# Altium schematic sheet ESP32_S3_TypeC.SchDoc
size A2; SheetNumber: 1; SheetTotal: 1
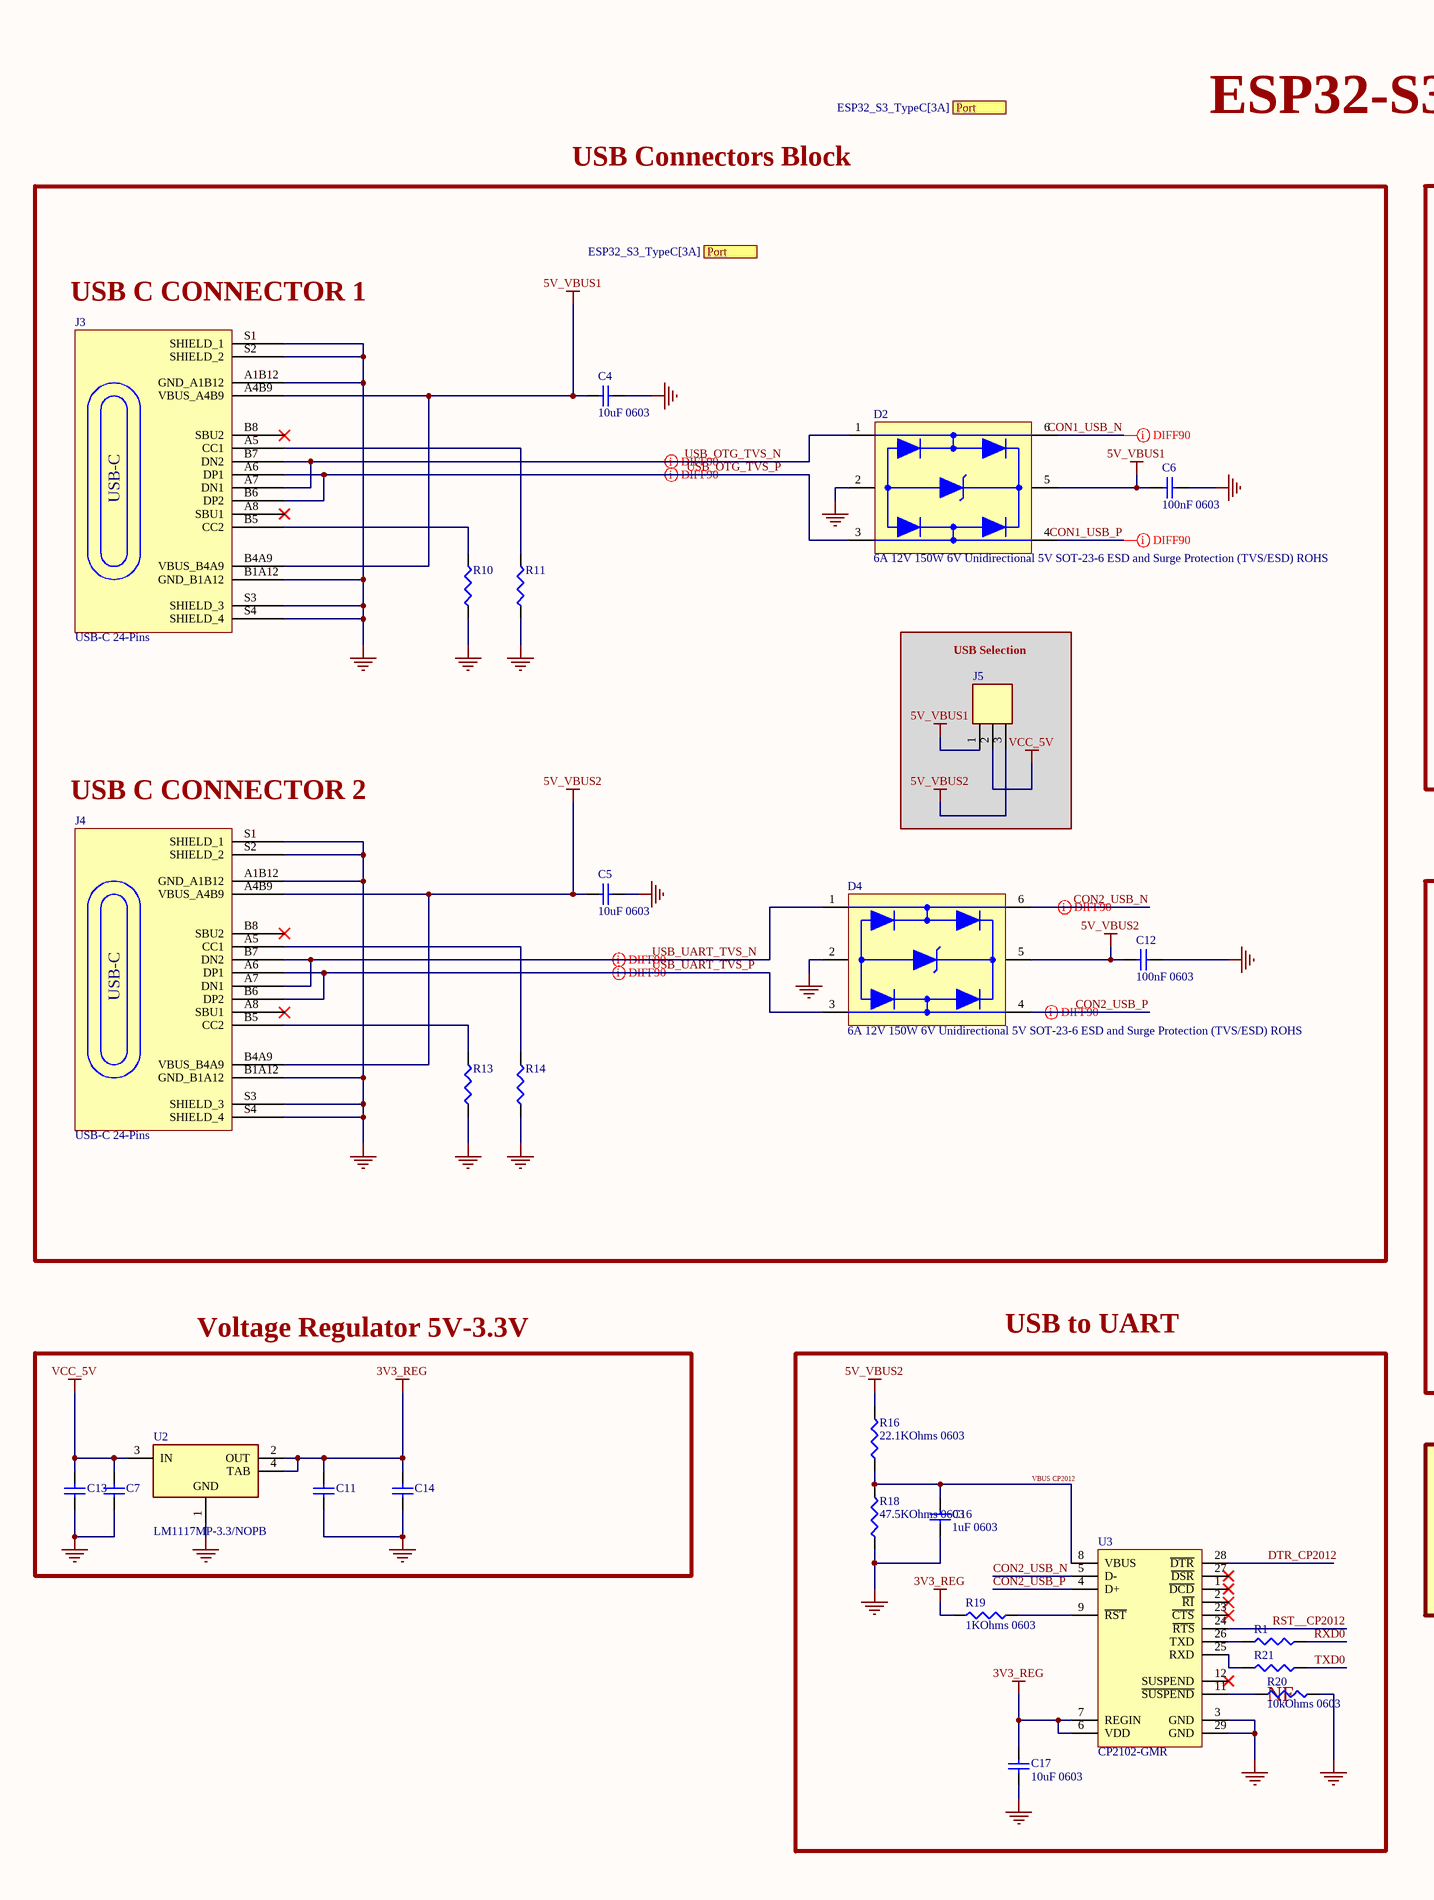
[diagram p0: ESP32_S3_TypeC.SchDoc, left]
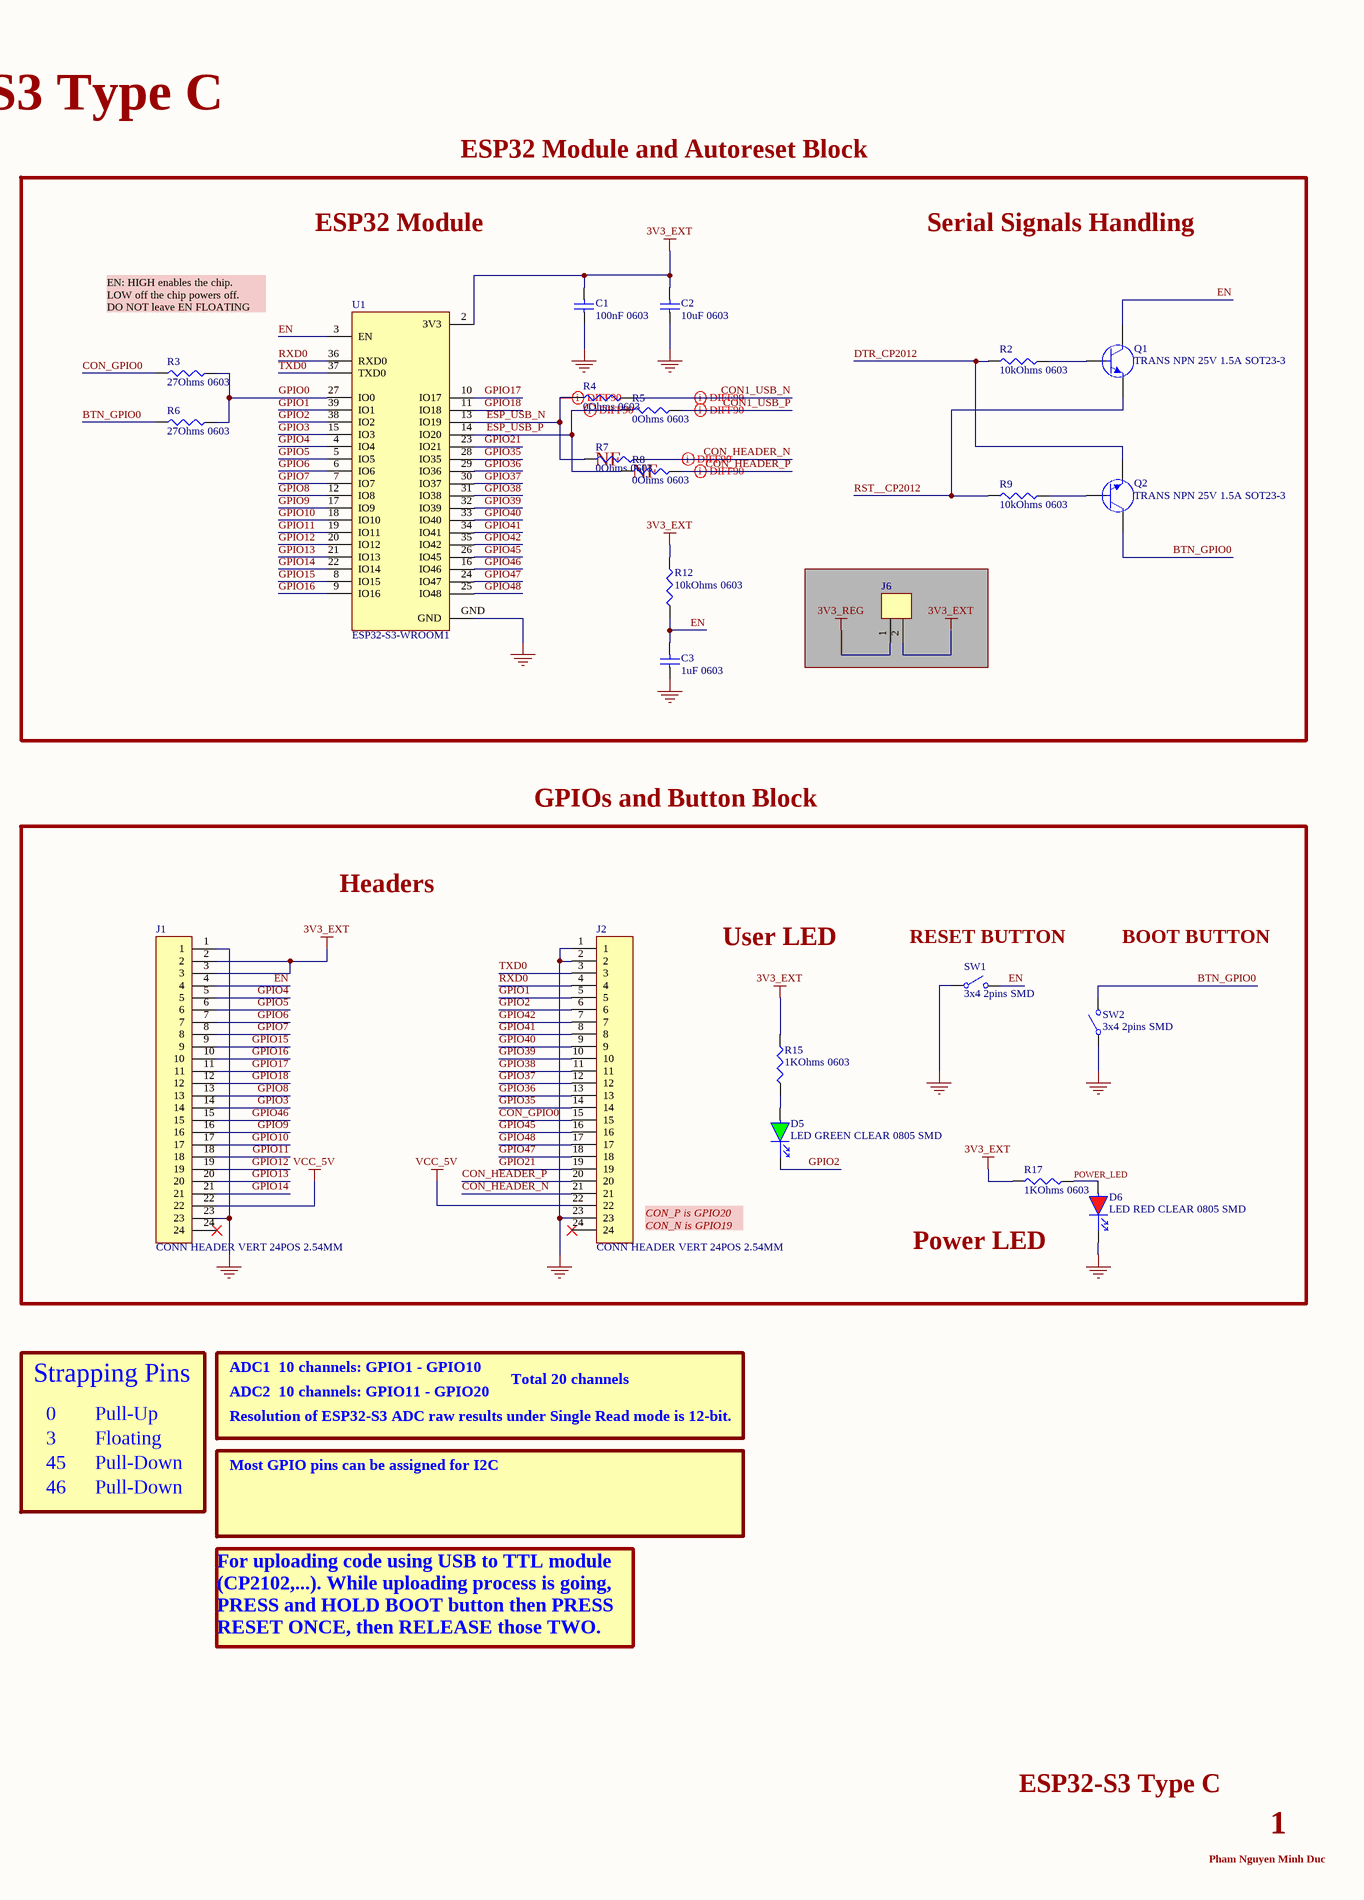
[diagram p1: ESP32_S3_TypeC.SchDoc, right]

## Parts
C1  100nF 0603  [CAPC1608X90N]
C2  10uF 0603  [CAPC1608X90N]
C3  1uF 0603  [CAPC1608X90N]
C4  10uF 0603  [CAPC1608X90N]
C5  10uF 0603  [CAPC1608X90N]
C6  100nF 0603  [CAPC1608X90N]
C7  100nF 0603  [CAPC1608X90N]  (value not drawn)
C11  100nF 0603  [CAPC1608X90N]  (value not drawn)
C12  100nF 0603  [CAPC1608X90N]
C13  10uF 0603  [CAPC1608X90N]  (value not drawn)
C14  10uF 0603  [CAPC1608X90N]  (value not drawn)
C16  1uF 0603  [CAPC1608X90N]
C17  10uF 0603  [CAPC1608X90N]
D2  6A 12V 150W 6V Unidirectional 5V SOT-23-6 ESD and Surge Protection (TVS/ESD) ROHS  [SOT95P280X145-6N]
D4  6A 12V 150W 6V Unidirectional 5V SOT-23-6 ESD and Surge Protection (TVS/ESD) ROHS  [SOT95P280X145-6N]
D5  LED GREEN CLEAR 0805 SMD  [LED 0805]
D6  LED RED CLEAR 0805 SMD  [LED 0805]
J1  CONN HEADER VERT 24POS 2.54MM  [HEADER_1x24]
J2  CONN HEADER VERT 24POS 2.54MM  [HEADER_1x24]
J3  USB-C 24-Pins  [MOLEX_2171790001]
J4  USB-C 24-Pins  [MOLEX_2171790001]
J5  1X3P 1.27mm Header  [HEADER 1x3_1.27MM]  (value not drawn)
J6  1X2P 1.27mm Header  [HEADER 1X2_1.27MM]  (value not drawn)
Q1  TRANS NPN 25V 1.5A SOT23-3  [FP-SS8050-G-IPC_C]
Q2  TRANS NPN 25V 1.5A SOT23-3  [FP-SS8050-G-IPC_C]
R1  0Ohms 0603  [0603_RES_1/10W]  (value not drawn)
R2  10kOhms 0603  [RES1608_0603]
R3  27Ohms 0603  [RES1608_0603]
R4  0Ohms 0603  [0603_RES_1/10W]
R5  0Ohms 0603  [0603_RES_1/10W]
R6  27Ohms 0603  [RES1608_0603]
R7  0Ohms 0603  [0603_RES_1/10W]
R8  0Ohms 0603  [0603_RES_1/10W]
R9  10kOhms 0603  [RES1608_0603]
R10  5.1KOhms 0603  [RES1608_0603]  (value not drawn)
R11  5.1KOhms 0603  [RES1608_0603]  (value not drawn)
R12  10kOhms 0603  [RES1608_0603]
R13  5.1KOhms 0603  [RES1608_0603]  (value not drawn)
R14  5.1KOhms 0603  [RES1608_0603]  (value not drawn)
R15  1KOhms 0603  [RES1608_0603]
R16  22.1KOhms 0603  [RES1608_0603]
R17  1KOhms 0603  [RES1608_0603]
R18  47.5KOhms 0603  [RES1608_0603]
R19  1KOhms 0603  [RES1608_0603]
R20  10kOhms 0603  [RES1608_0603]
R21  0Ohms 0603  [0603_RES_1/10W]  (value not drawn)
SW1  3x4 2pins SMD  [SW_TS-1088-AR02016]
SW2  3x4 2pins SMD  [SW_TS-1088-AR02016]
U1  ESP32-S3-WROOM1  [XCVR_ESP32-S3-WROOM-1-N16R2]
U2  LM1117MP-3.3/NOPB  [SOT223-4]
U3  CP2102-GMR  [SLAB-QFN-28-3125x3125TP_M]

## Blocks framed on the sheet
USB Selection: J5
USB to UART: C16 C17 R1 R16 R18-R21 U3

## Ports
Port (see ESP32_S3_TypeC[3A])

## Nets
3V3_EXT: C1.2 C2.2 J1.2 J1.3 J6.2 R12.2 R15.2 R17.1 U1.2(3V3)
3V3_REG: C11.2 C14.2 C17.2 J6.1 R19.1 U2.2(OUT) U2.4(TAB) U3.6(VDD) U3.7(REGIN)
5V_VBUS1: C4.1 C6.1 D2.5 J3.A4B9(VBUS_A4B9) J3.B4A9(VBUS_B4A9) J5.1
5V_VBUS2: C5.1 C12.1 D4.5 J4.A4B9(VBUS_A4B9) J4.B4A9(VBUS_B4A9) J5.3 R16.2
GND: C1.1 C2.1 C3.1 C4.2 C5.2 C6.2 C7.1 C11.1 C12.2 C13.1 C14.1 C16.1 C17.1 D2.2 D4.2 D6.2 J1.1 J1.23 J2.1 J2.2 J2.23 J3.A1B12(GND_A1B12) J3.B1A12(GND_B1A12) J3.S1(SHIELD_1) J3.S2(SHIELD_2) J3.S3(SHIELD_3) J3.S4(SHIELD_4) J4.A1B12(GND_A1B12) J4.B1A12(GND_B1A12) J4.S1(SHIELD_1) J4.S2(SHIELD_2) J4.S3(SHIELD_3) J4.S4(SHIELD_4) R10.1 R11.1 R13.1 R14.1 R18.1 R20.2 SW1.1 SW2.1 U1.GND U2.1(GND) U3.3(GND) U3.29(GND)
VCC_5V: C7.2 C13.2 J1.22 J2.22 J5.2 U2.3(IN)
BTN_GPIO0: Q2.3(C) R6.1 SW2.2
CON1_USB_N: D2.6 R4.2
CON1_USB_P: D2.4 R5.2
CON2_USB_N: D4.6 U3.5(D-)
CON2_USB_P: D4.4 U3.4(D+)
CON_GPIO0: J2.15 R3.1
CON_HEADER_N: J2.21 R7.2
CON_HEADER_P: J2.20 R8.2
DTR_CP2012: Q2.2(E) R2.1 U3.28(~{DTR})
EN: C3.2 J1.4 Q1.3(C) R12.1 SW1.2 U1.3(EN)
ESP_USB_N: R4.1 R7.1 U1.13(IO19)
ESP_USB_P: R5.1 R8.1 U1.14(IO20)
GPIO0: R3.2 R6.2 U1.27(IO0)
GPIO1: J2.5 U1.39(IO1)
GPIO2: D5.2 J2.6 U1.38(IO2)
GPIO3: J1.14 U1.15(IO3)
GPIO4: J1.5 U1.4(IO4)
GPIO5: J1.6 U1.5(IO5)
GPIO6: J1.7 U1.6(IO6)
GPIO7: J1.8 U1.7(IO7)
GPIO8: J1.13 U1.12(IO8)
GPIO9: J1.16 U1.17(IO9)
GPIO10: J1.17 U1.18(IO10)
GPIO11: J1.18 U1.19(IO11)
GPIO12: J1.19 U1.20(IO12)
GPIO13: J1.20 U1.21(IO13)
GPIO14: J1.21 U1.22(IO14)
GPIO15: J1.9 U1.8(IO15)
GPIO16: J1.10 U1.9(IO16)
GPIO17: J1.11 U1.10(IO17)
GPIO18: J1.12 U1.11(IO18)
GPIO21: J2.19 U1.23(IO21)
GPIO35: J2.14 U1.28(IO35)
GPIO36: J2.13 U1.29(IO36)
GPIO37: J2.12 U1.30(IO37)
GPIO38: J2.11 U1.31(IO38)
GPIO39: J2.10 U1.32(IO39)
GPIO40: J2.9 U1.33(IO40)
GPIO41: J2.8 U1.34(IO41)
GPIO42: J2.7 U1.35(IO42)
GPIO45: J2.16 U1.26(IO45)
GPIO46: J1.15 U1.16(IO46)
GPIO47: J2.18 U1.24(IO47)
GPIO48: J2.17 U1.25(IO48)
POWER_LED: D6.1 R17.2
RST__CP2012: Q1.2(E) R9.1 U3.24(~{RTS})
RXD0: J2.4 R1.2 U1.36(RXD0)
TXD0: J2.3 R21.2 U1.37(TXD0)
USB_OTG_TVS_N: D2.1 J3.A7(DN1) J3.B7(DN2)
USB_OTG_TVS_P: D2.3 J3.A6(DP1) J3.B6(DP2)
USB_UART_TVS_N: D4.1 J4.A7(DN1) J4.B7(DN2)
USB_UART_TVS_P: D4.3 J4.A6(DP1) J4.B6(DP2)
VBUS CP2012: C16.2 R16.1 R18.2 U3.8(VBUS)
NetD5_1: D5.1 R15.1
NetJ3_A5: J3.A5(CC1) R11.2
NetJ3_B5: J3.B5(CC2) R10.2
NetJ4_A5: J4.A5(CC1) R14.2
NetJ4_B5: J4.B5(CC2) R13.2
NetQ1_1: Q1.1(B) R2.2
NetQ2_1: Q2.1(B) R9.2
NetR1_1: R1.1 U3.26(TXD)
NetR19_2: R19.2 U3.9(~{RST})
NetR20_1: R20.1 U3.11(~{SUSPEND})
NetR21_1: R21.1 U3.25(RXD)

Not connected (* = marked no-connect by the designer): J1 24*; J2 24*; J3 A8(SBU1)* B8(SBU2)*; J4 A8(SBU1)* B8(SBU2)*; U3 1(~{DCD})* 2(~{RI})* 12(SUSPEND)* 23(~{CTS})* 27(~{DSR})*

## Layout directives
differential pair; differential pair class DIFF90: CON1_USB_N, CON1_USB_P, CON2_USB_N, CON2_USB_P, CON_HEADER_N, CON_HEADER_P, ESP_USB_N, ESP_USB_P, USB_OTG_TVS_N, USB_OTG_TVS_P, USB_UART_TVS_N, USB_UART_TVS_P

## Notes on the sheet
- ESP32-S3 Type C
- USB Connectors Block
- ESP32 Module and Autoreset Block
- (near J3) USB C CONNECTOR 1
- ESP32 Module
- Serial Signals Handling
- EN: HIGH enables the chip.
  LOW off the chip powers off.
  DO NOT leave EN FLOATING
- (near R7) NF
- NF
- (near J4) USB C CONNECTOR 2
- GPIOs and Button Block
- Headers
- User LED
- (near SW1) RESET BUTTON
- BOOT BUTTON
- Voltage Regulator 5V-3.3V
- CON_P is GPIO20
  CON_N is GPIO19
- Power LED
- ADC1
- 10 channels: GPIO1 - GPIO10
- Strapping Pins
- 0
- Pull-Up
- Resolution of ESP32-S3 ADC raw results under Single Read mode is 12-bit.
- ADC2
- 10 channels: GPIO11 - GPIO20
- Total 20 channels
- 45
- 46
- 3
- Pull-Down
- Floating
- Most GPIO pins can be assigned for I2C
- (near R20) NF
- For uploading code using USB to TTL module (CP2102,...). While uploading process is going, PRESS and HOLD BOOT button then PRESS RESET ONCE, then RELEASE those TWO.
- Pham Nguyen Minh Duc
- 1
- (in symbol 217179-0001) USB-C

## Library data of the parts
C1 C6 C7 C11 C12 = CL10E104KC8VPNC: 0.1 µF ±10% 100V Ceramic Capacitor X8L 0603 (1608 Metric); Manufacturer: Samsung; Supplier: Digikey; Supplier Part Number: 1276-CL10E104KC8VPNCCT-ND; Manufacturer Part Number: CL10E104KC8VPNC; RoHS: No; Category: Ceramic Capacitors; Stock: 57576; Pricing: 1=0.27, 10=0.154, 50=0.11, 100=0.0962, 500=0.07284, 1000=0.06554 (USD); LCSC Part Number: C2687355
C2 C4 C5 C13 C14 C17 = CL10A106MQ8NNNC: 10 µF ±20% 6.3V Ceramic Capacitor X5R 0603 (1608 Metric); Manufacturer: Samsung; Multilayer: Yes; Supplier: Digikey; Supplier Part Number: 1276-1119-1-ND; Manufacturer Part Number: CL10A106MQ8NNNC; RoHS: Yes; Category: Ceramic Capacitors; Stock: 1062557; Pricing: 1=0.08, 10=0.037, 50=0.0292, 100=0.0216, 500=0.0184, 1000=0.0152, 4000=0.0136, 8000=0.0112, 12000=0.0104, 20000=0.01024 (USD); Mounting Technology: Surface Mount; Pins: 2; Dielectric Material: Ceramic; Package Shape: Rectangular; Case/Package: 0603; Terminal Finish: Nickel; Min Operating Temperature: -55°C; Max Operating Temperature: 85°C; JESD-609 Code: e3; Value: 10uF; Capacitor Type: Ceramic; Tolerance  (fill in as +-): 20%; Package Style: SMTMeter; Packaging: Tape and Reel; Tolerance (fill in as +-): 20%; Rated DC Voltage (URdc): 6.3V; Temperature Characteristics Code: X5R; Termination: Wraparound; Length: 1.6mm; Width: 0.8mm; Height: 0.8mm; Reach SVHC Compliant: Yes; RoHS Compliant: Yes; ComponentLink1URL: https://datasheet.ciiva.com:443/pdfs/VipMasterIC/IC/SEMS/SEMS-S-A0008522793/SEMS-S-A0008522915-1.pdf?src-supplier=IHS+Markit; ComponentLink1Description: https://datasheet.ciiva.com:443/pdfs/VipMasterIC/IC/SEMS/SEMS-S-A0008522793/SEMS-S-A0008522915-1.pdf?src-supplier=IHS+Markit; ComponentLink2URL: https://datasheet.ciiva.com/25798/cl10a106mq8nnnc-25798320.pdf?src-supplier=Digikey; ComponentLink2Description: https://datasheet.ciiva.com/25798/cl10a106mq8nnnc-25798320.pdf?src-supplier=Digikey; ComponentLink3URL: https://datasheet.ciiva.com/16437/cl05b104kq5nnnc-16437327.pdf?src-supplier=Future+Electronics; ComponentLink3Description: https://datasheet.ciiva.com/16437/cl05b104kq5nnnc-16437327.pdf?src-supplier=Future+Electronics; LCSC Part Number: C385035
C3 C16 = CL10B105KP8NNNC: 1 µF ±10% 10V Ceramic Capacitor X7R 0603 (1608 Metric); Manufacturer: Samsung; Multilayer: Yes; Supplier: Digikey; Supplier Part Number: 1276-1946-1-ND; Manufacturer Part Number: CL10B105KP8NNNC; RoHS: Yes; Category: Ceramic Capacitors; Stock: 6476393; Pricing: 1=0.08, 10=0.014, 50=0.0124, 100=0.0104, 500=0.0092, 1000=0.008, 4000=0.008, 8000=0.00638, 12000=0.006, 20000=0.00559, 28000=0.00535, 40000=0.00511, 100000=0.00461, 200000=0.00431 (USD); Mounting Technology: Surface Mount; Pins: 2; Dielectric Material: Ceramic; Package Shape: Rectangular; Case/Package: 0603; Terminal Finish: Nickel; Min Operating Temperature: -55°C; Max Operating Temperature: 125°C; JESD-609 Code: e3; Value: 1uF; Capacitor Type: Ceramic; Tolerance  (fill in as +-): 10%; Package Style: SMTMeter; Packaging: Tape and Reel; Tolerance (fill in as +-): 10%; Rated DC Voltage (URdc): 10V; Temperature Characteristics Code: X7R; Termination: Wraparound; Length: 1.6mm; Width: 0.8mm; Height: 0.9mm; Reach SVHC Compliant: Yes; RoHS Compliant: Yes; ComponentLink1URL: https://datasheet.ciiva.com:443/pdfs/VipMasterIC/IC/SEMS/SEMS-S-A0008526420/SEMS-S-A0008526450-1.pdf?src-supplier=IHS+Markit; ComponentLink1Description: https://datasheet.ciiva.com:443/pdfs/VipMasterIC/IC/SEMS/SEMS-S-A0008526420/SEMS-S-A0008526450-1.pdf?src-supplier=IHS+Markit; ComponentLink2URL: https://datasheet.ciiva.com/25788/cl10b105kp8nnnc-25788304.pdf?src-supplier=Digikey; ComponentLink2Description: https://datasheet.ciiva.com/25788/cl10b105kp8nnnc-25788304.pdf?src-supplier=Digikey; LCSC Part Number: C15849
D2 D4 = USBLC6-2SC6: Manufacturer: STMicroelectronics; Diode Element Material: SILICON; Package Body Material: Plastic; Additional Feature: HIGH RELIABILITY; Clamping Voltage-Max: 17V; Diode Type: TRANS VOLTAGE SUPPRESSOR; Number of Elements: 1; Reference Standard: IEC-61000-4-2; Qualification Status: Not Qualified; Supplier: Digikey; Supplier Part Number: 497-5235-1-ND; Manufacturer Part Number: USBLC6-2SC6; RoHS: Yes; Category: TVS Diodes; Stock: 105122; Pricing: 1=0.36, 10=0.243, 100=0.1639, 500=0.1269, 1000=0.11458 (USD); Pins: 6; Package Shape: Rectangular; Terminal Finish: Tin; Min Operating Temperature: -40°C; Max Operating Temperature: 125°C; JESD-609 Code: e3; Polarity: Unidirectional; Min Breakdown Voltage: 6V; JESD-30 Code: R-PDSO-G6; Moisture Sensitivity Level: 1; Package Style: SMALL OUTLINEMeter; Peak Reflow Temperature (Cel): 260°C; Rep Pk Reverse Voltage-Max: 5V; Surface Mount: Yes; Technology: AVALANCHE; Terminal Form: Gull Wing; Terminal Position: DUAL; Reach SVHC Compliant: Yes; RoHS Compliant: Yes; ComponentLink1URL: https://datasheet.ciiva.com:443/pdfs/VipMasterIC/IC/SGST/SGSTS30336/SGSTS30336-1.pdf?src-supplier=IHS+Markit; ComponentLink1Description: https://datasheet.ciiva.com:443/pdfs/VipMasterIC/IC/SGST/SGSTS30336/SGSTS30336-1.pdf?src-supplier=IHS+Markit; ComponentLink2URL: https://datasheet.ciiva.com/1268/1690354-1268384.pdf?src-supplier=Element14; ComponentLink2Description: https://datasheet.ciiva.com/1268/1690354-1268384.pdf?src-supplier=Element14; ComponentLink3URL: https://datasheet.ciiva.com/4508/cd00050750-113117-4508433.pdf?src-supplier=Mouser; ComponentLink3Description: https://datasheet.ciiva.com/4508/cd00050750-113117-4508433.pdf?src-supplier=Mouser; ComponentLink4URL: https://datasheet.ciiva.com/41444/001184109-da-01-en-ic-esd-protecti-usblc6-2sc6-sot-23-6-stm-41444156.pdf?src-supplier=Conrad; ComponentLink4Description: https://datasheet.ciiva.com/41444/001184109-da-01-en-ic-esd-protecti-usblc6-2sc6-sot-23-6-stm-41444156.pdf?src-supplier=Conrad; LCSC Part Number: C2827654
D5 = 150080VS75000: Green 570nm LED Indication - Discrete 2V 0805 (2012 Metric); Manufacturer: Wurth Electronics; Shape: Rectangular; Lens Style: WATER CLEAR; Forward Current: 30mA; Luminous Intensity-Nom: 40mcd; Channels: 1; Optoelectronic Device Type: SINGLE COLOR LED; Viewing Angle: 140°; Overall Height: 0.7mm; Supplier: Digikey; Supplier Part Number: 732-4986-1-ND; Manufacturer Part Number: 150080VS75000; RoHS: Yes; Category: LEDs; Stock: 33035; Pricing: 1=0.18, 50=0.176, 100=0.151, 500=0.131, 4000=0.131 (USD); Mounting Technology: Surface Mount; Pins: 2; Color: Green; Min Operating Temperature: -40°C; Max Operating Temperature: 85°C; Packaging: Tape and Reel; Size: 1.4mm; Terminal Pitch: 2.1mm; Reach SVHC Compliant: Yes; RoHS Compliant: Yes; ComponentLink1URL: https://datasheet.ciiva.com:443/pdfs/VipMasterIC/IC/MIDC/MIDC-S-A0007455962/MIDC-S-A0007455962-1.pdf?src-supplier=IHS+Markit; ComponentLink1Description: https://datasheet.ciiva.com:443/pdfs/VipMasterIC/IC/MIDC/MIDC-S-A0007455962/MIDC-S-A0007455962-1.pdf?src-supplier=IHS+Markit; ComponentLink2URL: https://datasheet.ciiva.com/22656/150080vs75000-22656966.pdf?src-supplier=Element14; ComponentLink2Description: https://datasheet.ciiva.com/22656/150080vs75000-22656966.pdf?src-supplier=Element14; ComponentLink3URL: https://datasheet.ciiva.com/29279/759437-da-01-en-chipled-0805-w-kl-h-gruen-150080vs7500-29279047.pdf?src-supplier=Conrad; ComponentLink3Description: https://datasheet.ciiva.com/29279/759437-da-01-en-chipled-0805-w-kl-h-gruen-150080vs7500-29279047.pdf?src-supplier=Conrad; ComponentLink4URL: https://datasheet.ciiva.com/29563/150080vs75000-29563018.pdf?src-supplier=Digikey; ComponentLink4Description: https://datasheet.ciiva.com/29563/150080vs75000-29563018.pdf?src-supplier=Digikey; LCSC Part Number: C84257
D6 = 150080RS75000: Red 625nm LED Indication - Discrete 2V 0805 (2012 Metric); Manufacturer: Wurth Electronics; Shape: Rectangular; Lens Style: WATER CLEAR; Forward Current: 30mA; Luminous Intensity-Nom: 150mcd; Channels: 1; Optoelectronic Device Type: SINGLE COLOR LED; Viewing Angle: 140°; Overall Height: 0.7mm; Supplier: Digikey; Supplier Part Number: 732-4984-1-ND; Manufacturer Part Number: 150080RS75000; RoHS: Yes; Category: LEDs; Stock: 52184; Pricing: 1=0.18, 50=0.176, 100=0.151, 500=0.131, 4000=0.131 (USD); Mounting Technology: Surface Mount; Pins: 2; Color: Red; Min Operating Temperature: -40°C; Max Operating Temperature: 85°C; Packaging: Tape and Reel; Size: 1.4mm; Terminal Pitch: 2.1mm; Reach SVHC Compliant: Yes; RoHS Compliant: Yes; ComponentLink1URL: https://datasheet.ciiva.com:443/pdfs/VipMasterIC/IC/MIDC/MIDC-S-A0007455974/MIDC-S-A0007455974-1.pdf?src-supplier=IHS+Markit; ComponentLink1Description: https://datasheet.ciiva.com:443/pdfs/VipMasterIC/IC/MIDC/MIDC-S-A0007455974/MIDC-S-A0007455974-1.pdf?src-supplier=IHS+Markit; ComponentLink2URL: https://datasheet.ciiva.com/22656/150080rs75000-22656961.pdf?src-supplier=Element14; ComponentLink2Description: https://datasheet.ciiva.com/22656/150080rs75000-22656961.pdf?src-supplier=Element14; ComponentLink3URL: https://datasheet.ciiva.com/29279/759435-da-01-en-chipled-0805-w-kl-rot-150080rs75000-29279032.pdf?src-supplier=Conrad; ComponentLink3Description: https://datasheet.ciiva.com/29279/759435-da-01-en-chipled-0805-w-kl-rot-150080rs75000-29279032.pdf?src-supplier=Conrad; LCSC Part Number: C7496834
J1 J2 = 0022284242: Connector Header Through Hole 24 position 0.100" (2.54mm); Manufacturer: Molex; Supplier: Digikey; Supplier Part Number: WM50032-24-ND; Manufacturer Part Number: 0022284242; RoHS: Yes; Category: Uncategorized; Pricing: 1=1.49, 10=1.119, 100=0.8715, 500=0.75016, 1000=0.70789, 5000=0.62818, 10000=0.6005 (USD); ComponentLink1URL: http://components.arrow.com/part/dataview/4705328S3166250N3303?src-supplier=Arrow+Electronics; ComponentLink1Description: http://components.arrow.com/part/dataview/4705328S3166250N3303?src-supplier=Arrow+Electronics; ComponentLink2URL: http://www.molex.com/molex/products/datasheet.jsp?part=active/0022284242_PCB_HEADERS.xml&channel=Products&src-supplier=Avnet; ComponentLink2Description: http://www.molex.com/molex/products/datasheet.jsp?part=active/0022284242_PCB_HEADERS.xml&channel=Products&src-supplier=Avnet; ComponentLink3URL: https://www.molex.com/pdm_docs/sd/022284052_sd.pdf?src-supplier=Digikey; ComponentLink3Description: https://www.molex.com/pdm_docs/sd/022284052_sd.pdf?src-supplier=Digikey; LCSC Part Number: C5987590
J3 J4 = 217179-0001: USB-C (USB TYPE-C) USB 2.0 Receptacle Connector 24 (16+8 Dummy) Position Surface Mount, Right Angle; Through Hole; Manufacturer: Molex; Supplier: Digikey; Supplier Part Number: 900-2171790001CT-ND; Manufacturer Part Number: 217179-0001; RoHS: No; Category: Connectors; Stock: 14292; Pricing: 1=0.98, 10=0.731, 25=0.6564, 50=0.6074, 100=0.5642, 250=0.51468, 500=0.48234, 1200=0.44689, 2400=0.42258, 3600=0.40973, 6000=0.39484, 8400=0.38577, 12000=0.37675 (USD)
J5 = FTS-103-01-F-S: Connector Header Through Hole 3 position 0.050" (1.27mm); Manufacturer: Samtec; Manufacturer Series: FTS; Connector Type: BOARD CONNECTOR; Option: General Purpose; Additional Feature: Low Profile; Filter Feature: No; Number of Rows Loaded: 1; Number of Contacts: 3; Supplier: Digikey; Supplier Part Number: 612-FTS-103-01-F-S-ND; Manufacturer Part Number: FTS-103-01-F-S; RoHS: Yes; Category: Connectors; Stock: 2712; Pricing: 1=0.73, 50=0.6378, 100=0.5407, 500=0.4491, 1000=0.38362, 2000=0.31431, 5000=0.2478, 10000=0.2375 (USD); Mounting Technology: Board; Contact Material: Bronze; Contact Finish - Mating: GOLD (3) OVER NICKEL (50); Contact Finish - Termination: Matte Tin (Sn) - with Nickel (Ni) barrier; JESD-609 Code: e3; Contact Gender: Male; Mixed Contacts: No; Mounting Style: STRAIGHT; Termination: Solder; Terminal Pitch: 1.27mm; Flammability Rating: UL94 V-0; DIN Conformance: No; IEC Conformance: No; MIL Conformance: No; Reach SVHC Compliant: Yes; RoHS Compliant: Yes; ComponentLink1URL: https://datasheet.ciiva.com:443/pdfs/VipMasterIC/IC/SAMI/SAMI-S-A0001504673/SAMI-S-A0001504673-1.pdf?src-supplier=IHS+Markit; ComponentLink1Description: https://datasheet.ciiva.com:443/pdfs/VipMasterIC/IC/SAMI/SAMI-S-A0001504673/SAMI-S-A0001504673-1.pdf?src-supplier=IHS+Markit; ComponentLink2URL: http://suddendocs.samtec.com/prints/fts-1xx-xx-xx-xx-xx-mkt.pdf?src-supplier=Digikey; ComponentLink2Description: http://suddendocs.samtec.com/prints/fts-1xx-xx-xx-xx-xx-mkt.pdf?src-supplier=Digikey; ComponentLink3URL: http://www.samtec.com/documents/webfiles/pdf/FTS.pdf?src-supplier=Avnet; ComponentLink3Description: http://www.samtec.com/documents/webfiles/pdf/FTS.pdf?src-supplier=Avnet; ComponentLink4URL: https://datasheet.octopart.com/FTS-103-01-F-S-Samtec-datasheet-116535195.pdf?src-supplier=Toby+Electronics; ComponentLink4Description: https://datasheet.octopart.com/FTS-103-01-F-S-Samtec-datasheet-116535195.pdf?src-supplier=Toby+Electronics; ComponentLink5URL: https://datasheet.octopart.com/FTS-103-01-F-S-Samtec-datasheet-151470456.pdf?src-supplier=Sager+Electronics; ComponentLink5Description: https://datasheet.octopart.com/FTS-103-01-F-S-Samtec-datasheet-151470456.pdf?src-supplier=Sager+Electronics; LCSC Part Number: C2881648
J6 = M50-3530242: Connector Header Through Hole 2 position 0.050" (1.27mm); Manufacturer: Harwin; Connector Type: BOARD CONNECTOR; Option: General Purpose; Filter Feature: No; Number of Rows Loaded: 1; Number of Contacts: 2; Supplier: Digikey; Supplier Part Number: 952-3598-ND; Manufacturer Part Number: M50-3530242; RoHS: Yes; Category: Headers and Wire Housings; Stock: 9878; Pricing: 1=0.1, 10=0.08, 100=0.0655, 500=0.0568, 1000=0.0534, 5000=0.04629, 10000=0.04353 (USD); Mounting Technology: Board; Contact Finish - Mating: NOT SPECIFIED; Contact Gender: Male; Mixed Contacts: No; Mounting Style: STRAIGHT; Termination: Solder; Terminal Pitch: 1.27mm; Flammability Rating: UL94 V-0; Reach SVHC Compliant: Yes; RoHS Compliant: Yes; DIN Conformance: No; IEC Conformance: No; MIL Conformance: No; ComponentLink1URL: https://datasheet.ciiva.com:443/pdfs/VipMasterIC/IC/HRWN/HRWN-S-A0002541787/HRWN-S-A0002541787-1.pdf?src-supplier=IHS+Markit; ComponentLink1Description: https://datasheet.ciiva.com:443/pdfs/VipMasterIC/IC/HRWN/HRWN-S-A0002541787/HRWN-S-A0002541787-1.pdf?src-supplier=IHS+Markit; ComponentLink2URL: https://cdn.harwin.com/pdfs/Harwin_PC_Connectors_Archer.pdf?src-supplier=Digikey; ComponentLink2Description: https://cdn.harwin.com/pdfs/Harwin_PC_Connectors_Archer.pdf?src-supplier=Digikey; LCSC Part Number: C3325334
Q1 Q2 = SS8050-G: Bipolar (BJT) Transistor NPN 25 V 1.5 A 100MHz 300 mW Surface Mount SOT-23-3; Manufacturer: Comchip; Supplier: Digikey; Supplier Part Number: 641-1790-1-ND; Manufacturer Part Number: SS8050-G; RoHS: Yes; Category: Transistors; Stock: 93287; Pricing: 1=0.17, 10=0.113, 100=0.0755, 500=0.05756, 1000=0.05148 (USD); Reach SVHC Compliant: Yes; RoHS Compliant: Yes; ComponentLink1URL: https://datasheet.ciiva.com:443/pdfs/VipMasterIC/IC/COMC/COMC-S-A0004994192/COMC-S-A0004994192-1.pdf?src-supplier=IHS+Markit; ComponentLink1Description: https://datasheet.ciiva.com:443/pdfs/VipMasterIC/IC/COMC/COMC-S-A0004994192/COMC-S-A0004994192-1.pdf?src-supplier=IHS+Markit; ComponentLink2URL: http://www.comchiptech.com/admin/files/product/SS8050-G RevA181526.pdf?src-supplier=Digikey; ComponentLink2Description: http://www.comchiptech.com/admin/files/product/SS8050-G RevA181526.pdf?src-supplier=Digikey; LCSC Part Number: C3199946
R1 R4 R5 R7 R8 R21 = RC0603JR-070RL: 0 Ohms Jumper Chip Resistor 0603 (1608 Metric) Moisture Resistant Thick Film; Manufacturer: Yageo; Power: 100mW; Rated Temperature: 70°C; Value: 0R; Package Height: 0.45mm; Package Length: 1.6mm; Package Width: 0.8mm; Supplier: DigiKey; Supplier Part Number: 311-0.0GRCT-ND; Manufacturer Part Number: RC0603JR-070RL; RoHS: Yes; Category: Chip SMD Resistors; Stock: 3708630; Pricing: 1=0.1, 10=0.009, 25=0.0068, 50=0.004, 100=0.0036, 250=0.00304, 5000=0.00306, 10000=0.00185, 15000=0.00156, 25000=0.00138, 35000=0.00133 (USD); Mounting Technology: Surface Mount; Pins: 2; Package Shape: Rectangular; Case/Package: 0603; Terminal Finish: Nickel; Min Operating Temperature: -55°C; Max Operating Temperature: 155°C; JESD-609 Code: e3; Resistor Type: FIXED RESISTOR; Construction: Chip; Packaging: Tape and Reel; Technology: METAL GLAZE/THICK FILM; Termination: Wraparound; Reach SVHC Compliant: Yes; RoHS Compliant: Yes; ComponentLink1URL: https://datasheet.ciiva.com:443/pdfs/VipMasterIC/IC/YAGO/YAGO-S-A0008145938/YAGO-S-A0008145938-1.pdf?src-supplier=IHS+Markit; ComponentLink1Description: https://datasheet.ciiva.com:443/pdfs/VipMasterIC/IC/YAGO/YAGO-S-A0008145938/YAGO-S-A0008145938-1.pdf?src-supplier=IHS+Markit; ComponentLink2URL: https://datasheet.ciiva.com/15189/getdatasheetpartid-329462-15189845.pdf?src-supplier=Verical; ComponentLink2Description: https://datasheet.ciiva.com/15189/getdatasheetpartid-329462-15189845.pdf?src-supplier=Verical; LCSC Part Number: C21189
R2 R9 R12 R20 = RC0603FR-0710KL: 10 kOhms ±1% 0.1W, 1/10W Chip Resistor 0603 (1608 Metric) Moisture Resistant Thick Film; Manufacturer: Yageo; Additional Feature: LASER TRIMMABLE; Power: 100mW; Rated Temperature: 70°C; Value: 10kR; Working Voltage: 75V; Temperature Coefficient (ppm/Cel): 100; Package Height: 0.45mm; Package Length: 1.6mm; Package Width: 0.8mm; Supplier: Digikey; Supplier Part Number: 311-10.0KHRCT-ND; Manufacturer Part Number: RC0603FR-0710KL; RoHS: Yes; Category: Chip SMD Resistors; Stock: 5063682; Pricing: 1=0.1, 10=0.012, 50=0.0096, 100=0.0071, 500=0.00662, 1000=0.00612, 5000=0.00612, 10000=0.00263, 15000=0.00249, 25000=0.00221, 250000=0.00204, 500000=0.0019 (USD); Mounting Technology: Surface Mount; Pins: 2; Package Shape: Rectangular; Case/Package: 0603; Terminal Finish: Nickel; Min Operating Temperature: -55°C; Max Operating Temperature: 155°C; Tolerance: 1%; JESD-609 Code: e3; Resistor Type: FIXED RESISTOR; Construction: Chip; Packaging: Tape and Reel; Technology: METAL GLAZE/THICK FILM; Termination: Wraparound; Reach SVHC Compliant: Yes; RoHS Compliant: Yes; ComponentLink1URL: https://datasheet.ciiva.com:443/pdfs/VipMasterIC/IC/YAGO/YAGO-S-A0008145938/YAGO-S-A0008145938-1.pdf?src-supplier=IHS+Markit; ComponentLink1Description: https://datasheet.ciiva.com:443/pdfs/VipMasterIC/IC/YAGO/YAGO-S-A0008145938/YAGO-S-A0008145938-1.pdf?src-supplier=IHS+Markit; LCSC Part Number: C2930027
R3 R6 = RC0603FR-0727RL: 27 Ohms ±1% 0.1W, 1/10W Chip Resistor 0603 (1608 Metric) Moisture Resistant Thick Film; Manufacturer: Yageo; Additional Feature: LASER TRIMMABLE; Power: 100mW; Rated Temperature: 70°C; Value: 27R; Working Voltage: 75V; Temperature Coefficient (ppm/Cel): 100; Package Height: 0.45mm; Package Length: 1.6mm; Package Width: 0.8mm; Supplier: Digikey; Supplier Part Number: 311-27.0HRCT-ND; Manufacturer Part Number: RC0603FR-0727RL; RoHS: Yes; Category: Chip SMD Resistors; Stock: 313817; Pricing: 1=0.1, 10=0.011, 50=0.0086, 100=0.0061, 500=0.00562, 1000=0.0051, 5000=0.00408, 10000=0.00306, 15000=0.003 (USD); Mounting Technology: Surface Mount; Pins: 2; Package Shape: Rectangular; Case/Package: 0603; Terminal Finish: Nickel; Min Operating Temperature: -55°C; Max Operating Temperature: 155°C; Tolerance: 1%; JESD-609 Code: e3; Resistor Type: FIXED RESISTOR; Construction: Chip; Packaging: Tape and Reel; Technology: METAL GLAZE/THICK FILM; Termination: Wraparound; Reach SVHC Compliant: Yes; RoHS Compliant: Yes; ComponentLink1URL: https://datasheet.ciiva.com:443/pdfs/VipMasterIC/IC/YAGO/YAGO-S-A0008145938/YAGO-S-A0008145938-1.pdf?src-supplier=IHS+Markit; ComponentLink1Description: https://datasheet.ciiva.com:443/pdfs/VipMasterIC/IC/YAGO/YAGO-S-A0008145938/YAGO-S-A0008145938-1.pdf?src-supplier=IHS+Markit; ComponentLink2URL: https://datasheet.ciiva.com/2454/pyu-r-int-thick-7-2454030.pdf?src-supplier=Digikey; ComponentLink2Description: https://datasheet.ciiva.com/2454/pyu-r-int-thick-7-2454030.pdf?src-supplier=Digikey; ComponentLink3URL: https://datasheet.ciiva.com/2454/pyu-r-int-thick-7-2454031.pdf?src-supplier=Digikey; ComponentLink3Description: https://datasheet.ciiva.com/2454/pyu-r-int-thick-7-2454031.pdf?src-supplier=Digikey; ComponentLink4URL: https://datasheet.ciiva.com/2454/pyu-r-int-thick-7-2454032.pdf?src-supplier=Digikey; ComponentLink4Description: https://datasheet.ciiva.com/2454/pyu-r-int-thick-7-2454032.pdf?src-supplier=Digikey; ComponentLink5URL: https://datasheet.ciiva.com/7746/443971-7746313.pdf?src-supplier=Element14; ComponentLink5Description: https://datasheet.ciiva.com/7746/443971-7746313.pdf?src-supplier=Element14; ComponentLink6URL: https://datasheet.ciiva.com/7746/443971-7746314.pdf?src-supplier=Element14; ComponentLink6Description: https://datasheet.ciiva.com/7746/443971-7746314.pdf?src-supplier=Element14; LCSC Part Number: C25190
R10 R11 R13 R14 = RC0603FR-075K1L: 5.1 kOhms ±1% 0.1W, 1/10W Chip Resistor 0603 (1608 Metric) Moisture Resistant Thick Film; Manufacturer: Yageo; Additional Feature: LASER TRIMMABLE; Power: 100mW; Rated Temperature: 70°C; Value: 5.1kR; Working Voltage: 75V; Temperature Coefficient (ppm/Cel): 100; Package Height: 0.45mm; Package Length: 1.6mm; Package Width: 0.8mm; Supplier: Digikey; Supplier Part Number: 311-5.10KHRCT-ND; Manufacturer Part Number: RC0603FR-075K1L; RoHS: Yes; Category: Chip SMD Resistors; Stock: 1864234; Pricing: 1=0.1, 10=0.012, 50=0.0096, 100=0.0071, 500=0.00662, 1000=0.00612, 5000=0.00306, 10000=0.00255, 15000=0.00204, 25000=0.0019 (USD); Mounting Technology: Surface Mount; Pins: 2; Package Shape: Rectangular; Case/Package: 0603; Terminal Finish: Nickel; Min Operating Temperature: -55°C; Max Operating Temperature: 155°C; Tolerance: 1%; JESD-609 Code: e3; Resistor Type: FIXED RESISTOR; Construction: Chip; Packaging: Tape and Reel; Technology: METAL GLAZE/THICK FILM; Termination: Wraparound; Reach SVHC Compliant: Yes; RoHS Compliant: Yes; ComponentLink1URL: https://datasheet.ciiva.com:443/pdfs/VipMasterIC/IC/YAGO/YAGO-S-A0008145938/YAGO-S-A0008145938-1.pdf?src-supplier=IHS+Markit; ComponentLink1Description: https://datasheet.ciiva.com:443/pdfs/VipMasterIC/IC/YAGO/YAGO-S-A0008145938/YAGO-S-A0008145938-1.pdf?src-supplier=IHS+Markit; ComponentLink2URL: https://datasheet.ciiva.com/46395/443971-46395016.pdf?src-supplier=Element14; ComponentLink2Description: https://datasheet.ciiva.com/46395/443971-46395016.pdf?src-supplier=Element14; ComponentLink3URL: https://datasheet.ciiva.com/2454/pyu-r-int-thick-7-2454046.pdf?src-supplier=Digikey; ComponentLink3Description: https://datasheet.ciiva.com/2454/pyu-r-int-thick-7-2454046.pdf?src-supplier=Digikey; ComponentLink4URL: https://datasheet.ciiva.com/2454/pyu-r-int-thick-7-2454047.pdf?src-supplier=Digikey; ComponentLink4Description: https://datasheet.ciiva.com/2454/pyu-r-int-thick-7-2454047.pdf?src-supplier=Digikey; ComponentLink5URL: https://datasheet.ciiva.com/2454/pyu-r-int-thick-7-2454045.pdf?src-supplier=Digikey; ComponentLink5Description: https://datasheet.ciiva.com/2454/pyu-r-int-thick-7-2454045.pdf?src-supplier=Digikey; LCSC Part Number: C23186
R15 R17 R19 = RC0603FR-071KL: 1 kOhms ±1% 0.1W, 1/10W Chip Resistor 0603 (1608 Metric) Moisture Resistant Thick Film; Manufacturer: Yageo; Additional Feature: LASER TRIMMABLE; Power: 100mW; Rated Temperature: 70°C; Value: 1kR; Working Voltage: 75V; Temperature Coefficient (ppm/Cel): 100; Package Height: 0.45mm; Package Length: 1.6mm; Package Width: 0.8mm; Supplier: Digikey; Supplier Part Number: 311-1.00KHRCT-ND; Manufacturer Part Number: RC0603FR-071KL; RoHS: Yes; Category: Chip SMD Resistors; Stock: 5178243; Pricing: 1=0.1, 10=0.012, 50=0.0096, 100=0.0071, 500=0.00612, 1000=0.0051, 5000=0.0051, 10000=0.00263, 15000=0.00249, 25000=0.00221, 250000=0.00204, 500000=0.0019 (USD); Mounting Technology: Surface Mount; Pins: 2; Package Shape: Rectangular; Case/Package: 0603; Terminal Finish: Nickel; Min Operating Temperature: -55°C; Max Operating Temperature: 155°C; Tolerance: 1%; JESD-609 Code: e3; Resistor Type: FIXED RESISTOR; Construction: Chip; Packaging: Tape and Reel; Technology: METAL GLAZE/THICK FILM; Termination: Wraparound; Reach SVHC Compliant: Yes; RoHS Compliant: Yes; ComponentLink1URL: https://datasheet.ciiva.com:443/pdfs/VipMasterIC/IC/YAGO/YAGO-S-A0008145938/YAGO-S-A0008145938-1.pdf?src-supplier=IHS+Markit; ComponentLink1Description: https://datasheet.ciiva.com:443/pdfs/VipMasterIC/IC/YAGO/YAGO-S-A0008145938/YAGO-S-A0008145938-1.pdf?src-supplier=IHS+Markit; LCSC Part Number: C21190
R16 = RC0603FR-0722K1L: 22.1 kOhms ±1% 0.1W, 1/10W Chip Resistor 0603 (1608 Metric) Moisture Resistant Thick Film; Manufacturer: Yageo; Additional Feature: LASER TRIMMABLE; Power: 100mW; Rated Temperature: 70°C; Value: 22.1kR; Working Voltage: 75V; Temperature Coefficient (ppm/Cel): 100; Package Height: 0.45mm; Package Length: 1.6mm; Package Width: 0.8mm; Supplier: Digikey; Supplier Part Number: 311-22.1KHRCT-ND; Manufacturer Part Number: RC0603FR-0722K1L; RoHS: Yes; Category: Chip SMD Resistors; Stock: 53504; Pricing: 1=0.1, 10=0.012, 50=0.0096, 100=0.0071, 500=0.00562, 1000=0.00408, 5000=0.00408, 10000=0.00221, 15000=0.00204, 25000=0.0019 (USD); Mounting Technology: Surface Mount; Pins: 2; Package Shape: Rectangular; Case/Package: 0603; Terminal Finish: Nickel; Min Operating Temperature: -55°C; Max Operating Temperature: 155°C; Tolerance: 1%; JESD-609 Code: e3; Resistor Type: FIXED RESISTOR; Construction: Chip; Packaging: Tape and Reel; Technology: METAL GLAZE/THICK FILM; Termination: Wraparound; Reach SVHC Compliant: Yes; RoHS Compliant: Yes; ComponentLink1URL: https://datasheet.ciiva.com:443/pdfs/VipMasterIC/IC/YAGO/YAGO-S-A0008145938/YAGO-S-A0008145938-1.pdf?src-supplier=IHS+Markit; ComponentLink1Description: https://datasheet.ciiva.com:443/pdfs/VipMasterIC/IC/YAGO/YAGO-S-A0008145938/YAGO-S-A0008145938-1.pdf?src-supplier=IHS+Markit; ComponentLink2URL: https://datasheet.ciiva.com/12555/rc0603-272842-12555287.pdf?src-supplier=Mouser; ComponentLink2Description: https://datasheet.ciiva.com/12555/rc0603-272842-12555287.pdf?src-supplier=Mouser; LCSC Part Number: C25961
R18 = RC0603FR-074K75L: 47.5 kOhms ±1% 0.1W, 1/10W Chip Resistor 0603 (1608 Metric) Moisture Resistant Thick Film; Manufacturer: Yageo; Additional Feature: LASER TRIMMABLE; Power: 100mW; Rated Temperature: 70°C; Value: 4.75kR; Working Voltage: 75V; Temperature Coefficient (ppm/Cel): 100; Package Height: 0.45mm; Package Length: 1.6mm; Package Width: 0.8mm; Supplier: Digikey; Supplier Part Number: 311-4.75KHRCT-ND; Manufacturer Part Number: RC0603FR-074K75L; RoHS: Yes; Category: Chip SMD Resistors; Stock: 196773; Pricing: 1=0.1, 10=0.012, 50=0.0096, 100=0.0071, 500=0.00612, 1000=0.0051, 5000=0.00306, 10000=0.00221, 15000=0.00204, 25000=0.0019 (USD); Mounting Technology: Surface Mount; Pins: 2; Package Shape: Rectangular; Case/Package: 0603; Terminal Finish: Nickel; Min Operating Temperature: -55°C; Max Operating Temperature: 155°C; Tolerance: 1%; JESD-609 Code: e3; Resistor Type: FIXED RESISTOR; Construction: Chip; Packaging: Tape and Reel; Technology: METAL GLAZE/THICK FILM; Termination: Wraparound; Reach SVHC Compliant: Yes; RoHS Compliant: Yes; ComponentLink1URL: https://datasheet.ciiva.com:443/pdfs/VipMasterIC/IC/YAGO/YAGO-S-A0008145938/YAGO-S-A0008145938-1.pdf?src-supplier=IHS+Markit; ComponentLink1Description: https://datasheet.ciiva.com:443/pdfs/VipMasterIC/IC/YAGO/YAGO-S-A0008145938/YAGO-S-A0008145938-1.pdf?src-supplier=IHS+Markit; LCSC Part Number: C2933225
SW1 SW2 = TS-1088-AR02016: Without 50mA 4mm 100MΩ 100000 Times 12V 160gf 3mm 2mm Round Button Standing paste SPST SMD Tactile Switches ROHS; LCSC Part Number: C720477
U2 = LM1117MP-3.3/NOPB: IC REG LINEAR 3.3V 800MA SOT223; Manufacturer: TI National Semiconductor; Supplier: Digikey; Supplier Part Number: LM1117MP-3.3/NOPBCT-ND; Manufacturer Part Number: LM1117MP-3.3/NOPB; RoHS: Yes; Category: Voltage Regulators - Linear; Stock: 63878; Pricing: 1=1.38, 10=1.007, 25=0.9128, 100=0.8093, 250=0.75996, 500=0.73016 (USD); LCSC Part Number: C411821
U3 = CP2102-GMR: USB Bridge, USB to UART USB 2.0 UART Interface 28-QFN (5x5); Manufacturer: Silicon Labs; Power Supplies: 3.3V; Max Supply Voltage: 3.6V; Min Supply Voltage: 3V; Time @ Peak Reflow Temperature-Max (s): 40s; Qualification Status: Not Qualified; Supplier: Digikey; Supplier Part Number: 336-1160-1-ND; Manufacturer Part Number: CP2102-GMR; RoHS: Yes; Category: Interface ICs; Stock: 54529; Pricing: 1=6.54, 10=5.908, 25=5.6328, 100=4.8909, 250=4.83752, 1500=4.8375 (USD); Case/Package: HVQCCN; Pins: 28; Package Shape: Square; Terminal Finish: Tin; Min Operating Temperature: -40°C; Max Operating Temperature: 85°C; JESD-609 Code: e3; Moisture Sensitivity Level: 1; Package Style: CHIP CARRIER, HEAT SINK/SLUG, VERY THIN PROFILEMeter; Peak Reflow Temperature (Cel): 260°C; Nominal Supply Voltage: 3.3V; Surface Mount: Yes; Technology: CMOS; Terminal Form: No Lead; Terminal Position: QUAD; Length: 5mm; Width: 5mm; Height - Seated (Max): 1mm; Terminal Pitch: 0.5mm; Temperature Grade: INDUSTRIAL; Reach SVHC Compliant: Yes; RoHS Compliant: Yes; ComponentLink1URL: https://datasheet.ciiva.com:443/pdfs/VipMasterIC/IC/SILC/SILCS01275/SILCS01275-1.pdf?src-supplier=IHS+Markit; ComponentLink1Description: https://datasheet.ciiva.com:443/pdfs/VipMasterIC/IC/SILC/SILCS01275/SILCS01275-1.pdf?src-supplier=IHS+Markit; ComponentLink2URL: https://datasheet.ciiva.com/6636/cp2102-9-6636566.pdf?src-supplier=Digikey; ComponentLink2Description: https://datasheet.ciiva.com/6636/cp2102-9-6636566.pdf?src-supplier=Digikey; ComponentLink3URL: https://datasheet.ciiva.com/6636/cp2102-9-6636571.pdf?src-supplier=Digikey; ComponentLink3Description: https://datasheet.ciiva.com/6636/cp2102-9-6636571.pdf?src-supplier=Digikey; LCSC Part Number: C6568